# Altium schematic sheet RevisedNewMemberProject.SchDoc
size A; SheetNumber: 1; SheetTotal: 1
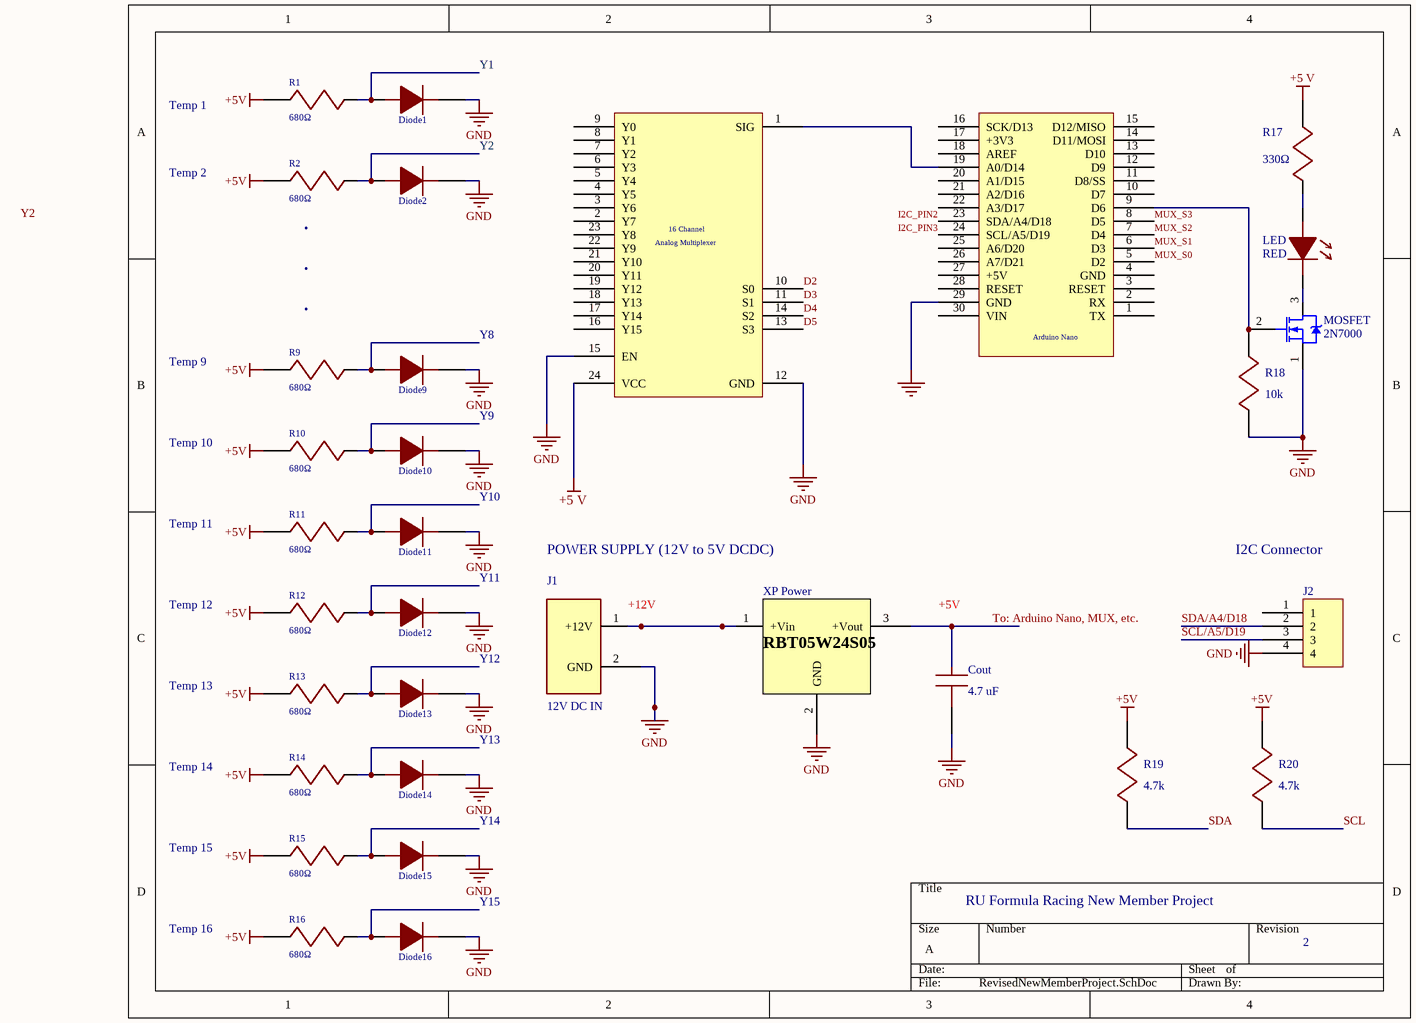
[diagram p0: RevisedNewMemberProject.SchDoc]

## Parts
(Parts that share a designator on the sheet are numbered #1, #2 ... from top to bottom, then left to right.)
?#1  (no value)
?#2  (no value)
Cout  4.7 uF
Diode1  1N4148  (value not drawn)
Diode2  1N4148  (value not drawn)
Diode9  1N4148  (value not drawn)
Diode10  1N4148  (value not drawn)
Diode11  1N4148  (value not drawn)
Diode12  1N4148  (value not drawn)
Diode13  1N4148  (value not drawn)
Diode14  1N4148  (value not drawn)
Diode15  1N4148  (value not drawn)
Diode16  1N4148  (value not drawn)
J1  12V DC IN
J2  (no value)
LED  RED
MOSFET  2N7000  [ONSC-TO-92-3-29-11]
R1  680Ω
R2  680Ω
R9  680Ω
R10  680Ω
R11  680Ω
R12  680Ω
R13  680Ω
R14  680Ω
R15  680Ω
R16  680Ω
R17  330Ω
R18  10k
R19  4.7k
R20  4.7k
XP_Power  (no value)

## Nets
+5 V: ?#1.24(VCC) R17.1
+5V: R1.1 R2.1 R9.1 R10.1 R11.1 R12.1 R13.1 R14.1 R15.1 R16.1 R19.1 R20.1
GND: ?#1.12(GND) ?#1.15(EN) Cout.2 Diode1.1(K) Diode2.1(K) Diode9.1(K) Diode10.1(K) Diode11.1(K) Diode12.1(K) Diode13.1(K) Diode14.1(K) Diode15.1(K) Diode16.1(K) J1.2(GND) J2.4 MOSFET.1(S) R18.2 XP_Power.2(GND)
D2: ?#1.10(S0)
D3: ?#1.11(S1)
D4: ?#1.14(S2)
D5: ?#1.13(S3)
MUX_S0: ?#2.5(D2)
MUX_S1: ?#2.6(D3)
MUX_S2: ?#2.7(D4)
MUX_S3: ?#2.8(D5)
SCL: R20.2
SDA: R19.2
Net?#1_1: ?#1.1(SIG) ?#2.19(A0/D14)
Net?#2_9: ?#2.9(D6) MOSFET.2(G) R18.1
NetCout_1: Cout.1 XP_Power.3(+Vout)
NetDiode1_2: Diode1.2(A) R1.2
NetDiode2_2: Diode2.2(A) R2.2
NetDiode9_2: Diode9.2(A) R9.2
NetDiode10_2: Diode10.2(A) R10.2
NetDiode11_2: Diode11.2(A) R11.2
NetDiode12_2: Diode12.2(A) R12.2
NetDiode13_2: Diode13.2(A) R13.2
NetDiode14_2: Diode14.2(A) R14.2
NetDiode15_2: Diode15.2(A) R15.2
NetDiode16_2: Diode16.2(A) R16.2
NetJ1_1: J1.1(+12V) XP_Power.1(+Vin)
NetLED_1: LED.1(K) MOSFET.3(D)
NetLED_2: LED.2(A) R17.2

Not connected (* = marked no-connect by the designer): ?#1 2(Y7) 3(Y6) 4(Y5) 5(Y4) 6(Y3) 7(Y2) 8(Y1) 9(Y0) 16(Y15) 17(Y14) 18(Y13) 19(Y12) 20(Y11) 21(Y10) 22(Y9) 23(Y8); ?#2 1(TX) 2(RX) 3(RESET) 4(GND) 10(D7) 11(D8/SS) 12(D9) 13(D10) 14(D11/MOSI) 15(D12/MISO) 16(SCK/D13) 17(+3V3) 18(AREF) 20(A1/D15) 21(A2/D16) 22(A3/D17) 23(SDA/A4/D18) 24(SCL/A5/D19) 25(A6/D20) 26(A7/D21) 27(+5V) 28(RESET) 29(GND) 30(VIN); J2 1 2 3

## Notes on the sheet
- (near Diode1) Y1
- Temp 1
- Y2
- Temp 2
- (near R2) .
- I2C_PIN2
- I2C_PIN3
- .
- Temp 9
- (near Diode9) Y8
- Y9
- Temp 10
- Y10
- Temp 11
- POWER SUPPLY (12V to 5V DCDC)
- I2C Connector
- Temp 12
- Y11
- (near J1) +12V
- (near Cout) +5V
- (near Cout) To: Arduino Nano, MUX, etc.
- SDA/A4/D18
- SCL/A5/D19
- Temp 13
- Y12
- Temp 14
- Y13
- Y14
- Temp 15
- Y15
- RU Formula Racing New Member Project
- Temp 16
- 2
- Labels drawn without touching a wire or pin: Y2
- (in symbol Arduino_Nano) Arduino Nano
- (in symbol Multiplexer) 16 Channel; Analog Multiplexer

## Library data of the parts
?#1 = Multiplexer
?#2 = Arduino_Nano
Cout = Cap: Capacitor 10 uF 25 V (DC-DC input)
Diode1 Diode2 Diode9-Diode16 = Diode 1N4148: Temperature-sensing silicon diode (1N4148-type, verify issued part)
J1 = Header 2: 2-pin 12 V DC input connector
J2 = I2C Component
LED = LED0: Red LED - FAULT (blinks 2 Hz)
MOSFET = CMP-1058-00936-1: Small Signal MOSFET, 200 mA, 60 V, N-Channel, 3-Pin TO-92, Bulk Box; Manufacturer: On Semiconductor; Ciss Typ (pF): 60; VGS(th) Max (V): 3; Crss Typ (pF): 5; Channel Polarity: N Channel; VGS Max (V): 20; Configuration: Single; PD Max (W): 0.35; Coss Typ (pF): 25; ID Max (A): 0.2; PackageVersion: Rev. AM; ComponentLink3URL: http://www.onsemi.cn/pub_link/Collateral/2N6426-D.PDF; ComponentLink2URL: http://www.onsemi.com/pub_link/Collateral/2N7000-D.PDF; DatasheetVersion: Rev. 8; Mounting Technology: Through Hole; V(BR)DSS Min (V): 60; PartNumber: 2N7000; PackageDescription: 3-Pin Transistor Outline, Body 4.825 x 3.685 mm, Pitch 1.27 mm; ComponentLink2Description: Datasheet; ComponentLink1URL: http://www.onsemi.com/; PackageReference: TO-92-3-29-11_AM_SL; Packing: Bulk Box; ComponentLink1Description: Manufacturer URL; Package Type: TO-92; ComponentLink3Description: Package Specification
R1 R2 R9-R16 = Res2: Resistor 4.7 kOhm sensor bias (~0.94 mA)
R17 = Res2: Resistor 330 Ohm LED current (~9 mA)
R18 R20 = Res2: Resistor 4.7 kOhm I2C SCL pull-up
R19 = Res2: Resistor 4.7 kOhm I2C SDA pull-up
XP_Power = RBT05W24S05